# EasyEDA Pro project wavie-main-board-v0.1.epro, schematic Wavie Schematic
Board Name: Wavie; Create Date: 2025-11-19; Page Name: P1; Project Name: Wavie V0.1; Schematic Name: Wavie Schematic; Update Date: 2026-07-30; Company: ReefMetrics; Drawn: ReefMetrics; Page Size: A4; Version: V0.2
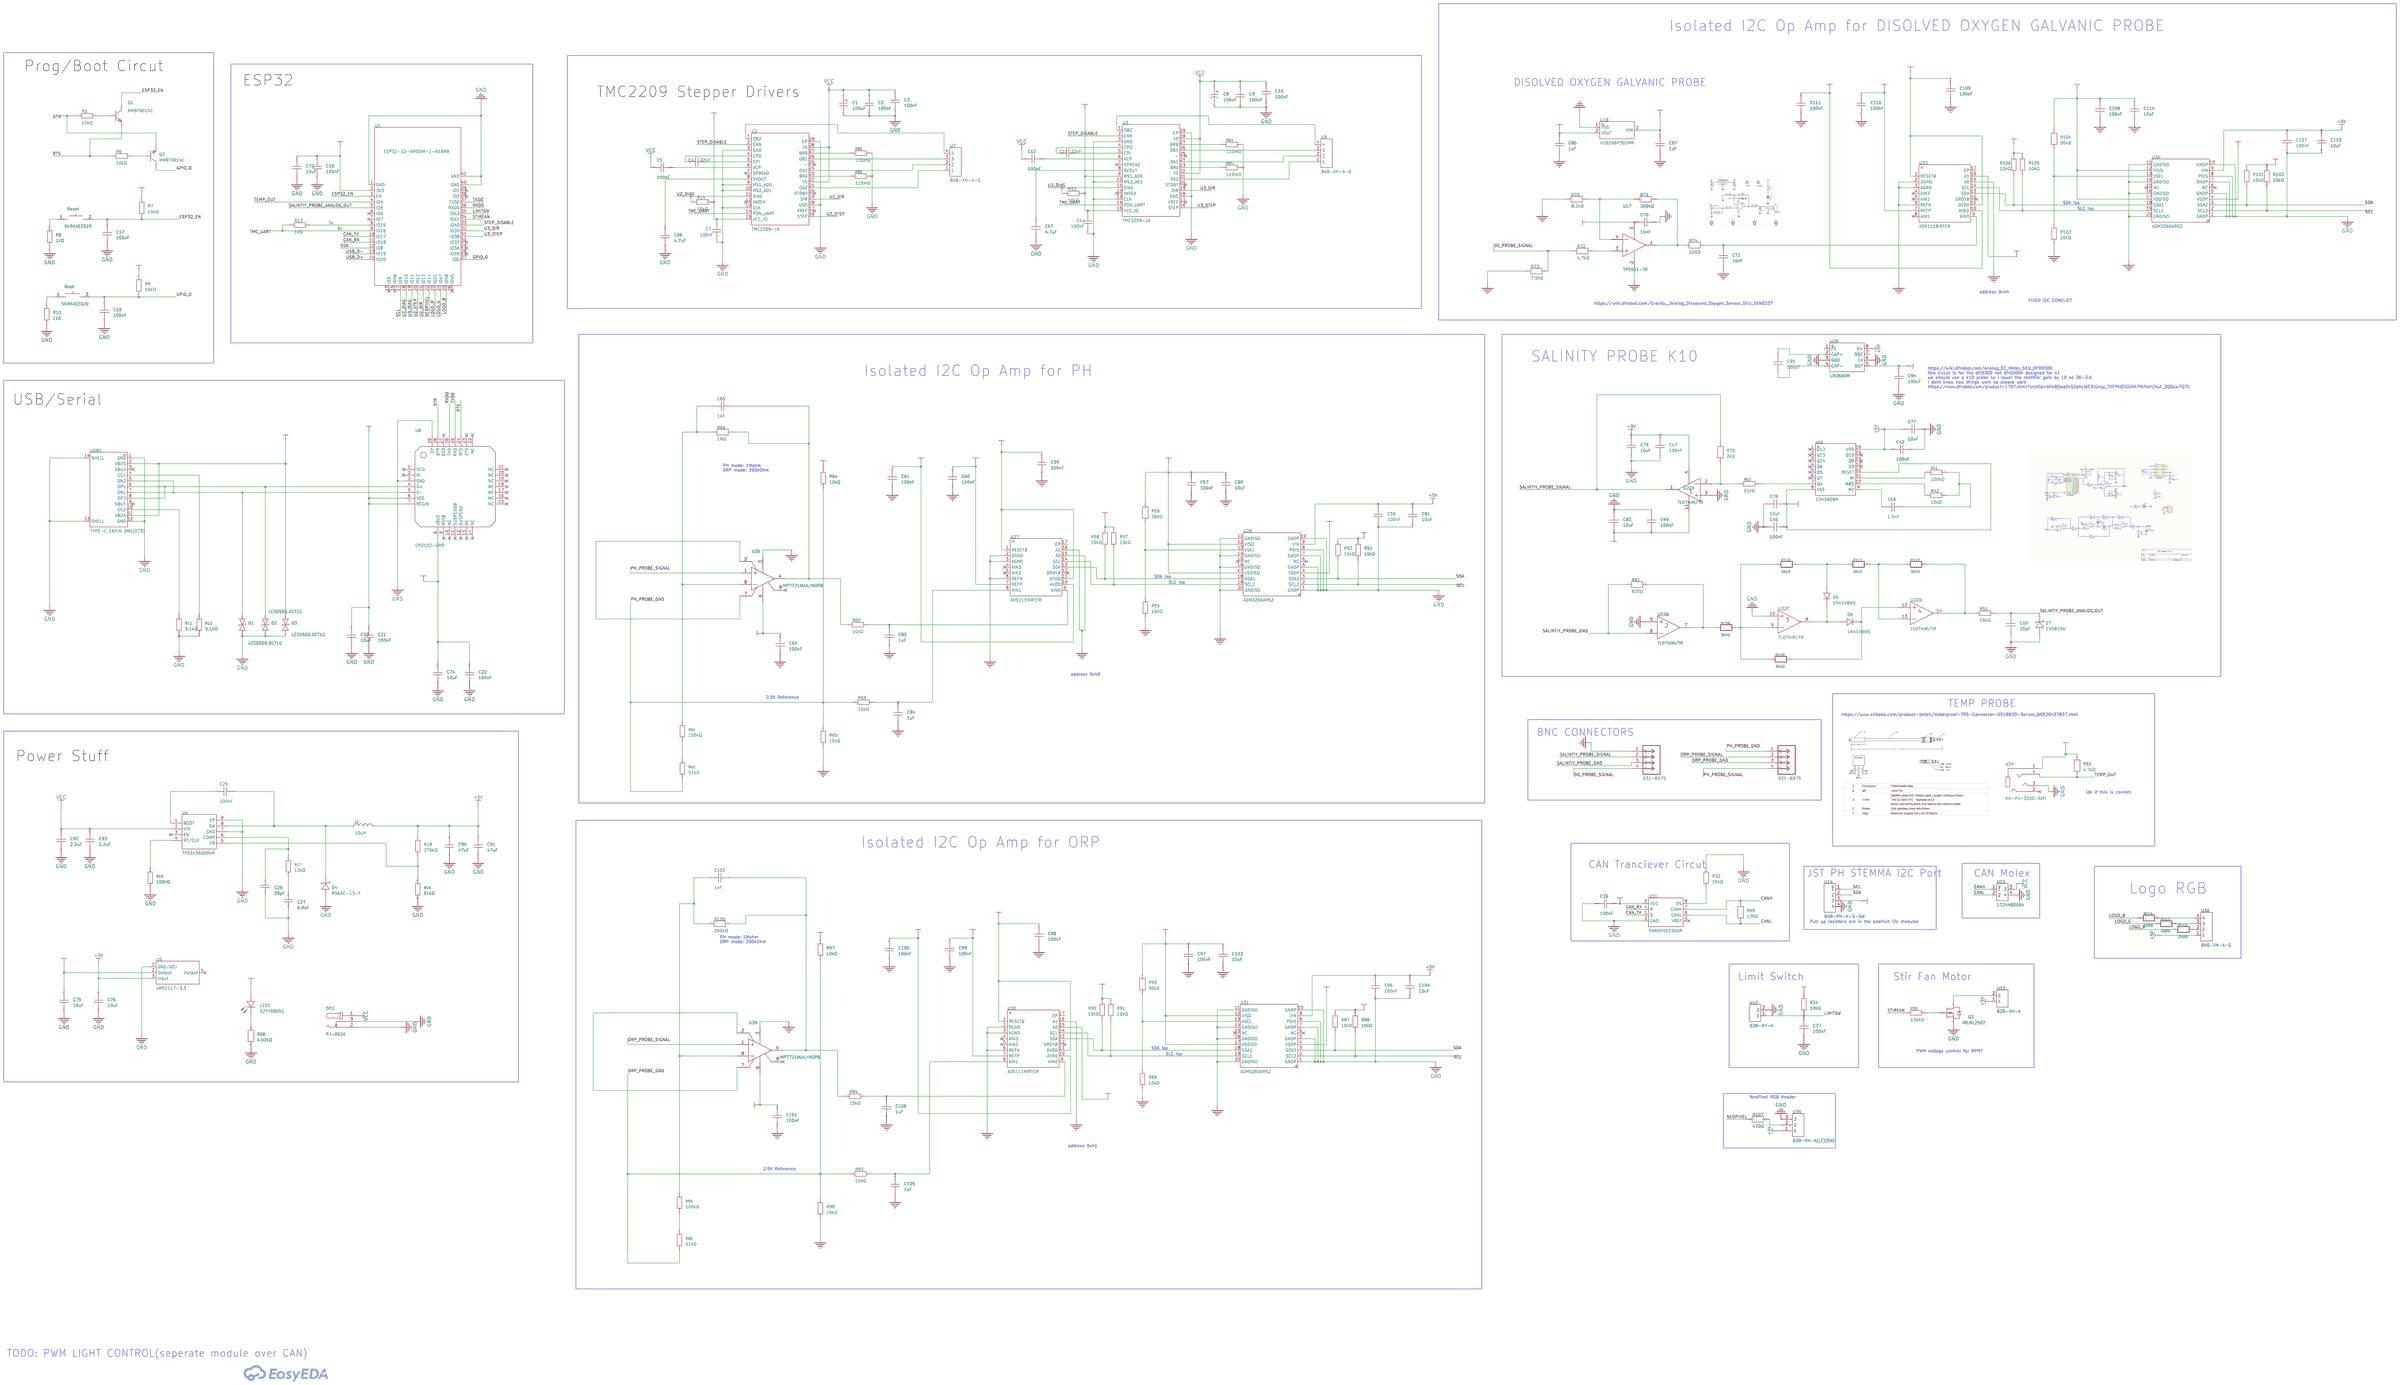
[diagram p0: schematic sheet]

## Parts
Boot  SKRKAEE020  [SW-SMD_L3.9-W3.0-P4.45]
C1  100uF  [CAP-SMD_BD6.3-L6.6-W6.6-LS7.2-FD]
C2  100nF  [C0402]
C3  100nF  [C0402]
C4  22nF  [C0402]
C5  100nF  [C0402]
C7  100nF  [C0402]
C8  100uF  [CAP-SMD_BD6.3-L6.6-W6.6-LS7.2-FD]
C9  100nF  [C0402]
C10  100nF  [C0402]
C11  22nF  [C0402]
C12  100nF  [C0402]
C14  100nF  [C0402]
C16  100nF  [C0402]
C17  100nF  [C0402]
C18  100nF  [C0402]
C21  100nF  [C0402]
C22  100nF  [C0402]
C25  100nF  [C0402]
C26  39pF  [C0402]
C27  6.8nF  [C0402]
C36  100nF  [C0402]
C37  100nF  [C0402]
C42  100nF  [C0402]
C45  100nF  [C0402]
C47  100nF  [C0402]
C49  100nF  [C0402]
C55  100nF  [C0402]
C57  100nF  [C0402]
C59  100nF  [C0402]
C60  100nF  [C0402]
C61  100nF  [C0402]
C64  100nF  [C0402]
C65  1nF  [C0402]
C66  4.7uF  [C0402]
C67  4.7uF  [C0402]
C68  1.5nF  [C0402]
C69  20pF  [C0402]
C70  10nF  [C0402]
C71  10nF  [C0402]
C72  10uF  [C0402]
C73  10uF  [C0402]
C74  10uF  [C0402]
C75  10uF  [C0402]
C76  10uF  [C0402]
C77  10uF  [C0402]
C78  10uF  [C0402]
C79  10uF  [C0402]
C80  10uF  [C0402]
C81  10uF  [C0402]
C83  10uF  [C0402]
C84  1uF  [C0402]
C85  1uF  [C0402]
C86  1uF  [C0402]
C87  1uF  [C0402]
C90  47uF  [C0805]
C91  47uF  [C0805]
C92  2.2uF  [C0402]
C93  2.2uF  [C0402]
C94  100uF  [C0805]
C95  100uF  [C0805]
C96  100nF  [C0402]
C97  100nF  [C0402]
C98  100nF  [C0402]
C99  100nF  [C0402]
C100  100nF  [C0402]
C101  100nF  [C0402]
C102  1nF  [C0402]
C103  10uF  [C0402]
C104  10uF  [C0402]
C105  1uF  [C0402]
C106  1uF  [C0402]
C107  100nF  [C0402]
C108  100nF  [C0402]
C109  100nF  [C0402]
C110  100nF  [C0402]
C111  100nF  [C0402]
C114  10uF  [C0402]
C115  10uF  [C0402]
D1  LESD5D5.0CT1G  [SOD-523_L1.2-W0.8-LS1.6-BI]
D2  LESD5D5.0CT1G  [SOD-523_L1.2-W0.8-LS1.6-BI]
D3  LESD5D5.0CT1G  [SOD-523_L1.2-W0.8-LS1.6-BI]
D4  B560C-13-F  [SMC_L7.1-W6.2-LS8.1-RD]
D5  1N4148WS  [SOD-323_L1.8-W1.3-LS2.5-RD]
D6  1N4148WS  [SOD-323_L1.8-W1.3-LS2.5-RD]
D7  1N5819W  [SOD-123_L2.7-W1.6-LS3.7-RD-1]
DC1  PJ-002A  [DC-IN-TH_PJ-002A]
L1  10uH  [IND-SMD_L7.1-W6.6]
LED1  SZYY0805G  [LED0805-R-RD]
Q1  MMBT9014C  [SOT-23-3_L2.9-W1.3-P1.90-LS2.4-BR]
Q2  MMBT9014C  [SOT-23-3_L2.9-W1.3-P1.90-LS2.4-BR]
Q3  IRLML2502  [SOT-23-3_L2.9-W1.3-P1.90-LS2.4-BR]
R5  10kΩ  [R0402]
R6  10kΩ  [R0402]
R7  10kΩ  [R0402]
R8  1kΩ  [R0402]
R9  10kΩ  [R0402]
R10  1kΩ  [R0402]
R11  5.1kΩ  [R0402]
R12  5.1kΩ  [R0402]
R13  1kΩ  [R0402]
R14  10kΩ  [R0402]
R15  10kΩ  [R0402]
R16  100kΩ  [R0402]
R17  13kΩ  [R0402]
R18  270kΩ  [R0402]
R19  51kΩ  [R0402]
R32  10kΩ  [R0402]
R34  10kΩ  [R0402]
R35  100kΩ  [R0402]
R41  100kΩ  [R0402]
R42  10kΩ  [R0402]
R51  10kΩ  [R0402]
R53  10kΩ  [R0402]
R54  10kΩ  [R0402]
R55  10kΩ  [R0402]
R56  30kΩ  [R0402]
R57  10kΩ  [R0402]
R58  10kΩ  [R0402]
R59  10kΩ  [R0402]
R60  10kΩ  [R0402]
R61  100kΩ  [R0402]
R62  51kΩ  [R0402]
R63  51kΩ  [R0402]
R64  10kΩ  [R0402]
R65  10kΩ  [R0402]
R66  1MΩ  [R0402]
R68  4.02kΩ  [R0402]
R69  120Ω  [R0402]
R70  8.2kΩ  [R0402]
R71  300kΩ  [R0402]
R72  4.7kΩ  [R0402]
R73  7.5kΩ  [R0402]
R74  220Ω  [R0402]
R75  2kΩ  [R0402]
R81  820Ω  [R0402]
R82  4.7kΩ  [R0402]
R83  110mΩ  [R0603]
R84  110mΩ  [R0603]
R85  110mΩ  [R0603]
R86  110mΩ  [R0603]
R87  10kΩ  [R0402]
R88  10kΩ  [R0402]
R89  10kΩ  [R0402]
R90  30kΩ  [R0402]
R91  10kΩ  [R0402]
R92  10kΩ  [R0402]
R93  10kΩ  [R0402]
R94  10kΩ  [R0402]
R95  100kΩ  [R0402]
R96  51kΩ  [R0402]
R97  10kΩ  [R0402]
R98  10kΩ  [R0402]
R100  200kΩ  [R0402]
R101  10kΩ  [R0402]
R102  10kΩ  [R0402]
R103  10kΩ  [R0402]
R104  30kΩ  [R0402]
R105  10kΩ  [R0402]
R106  10kΩ  [R0402]
R107  470Ω  [R0402]
R108  36kΩ  [R0402]
R109  36kΩ  [R0402]
R110  36kΩ  [R0402]
R111  36kΩ  [R0402]
R112  36kΩ  [R0402]
R113  100Ω  [R0402]
R114  100Ω  [R0402]
R115  150Ω  [R0402]
Reset  SKRKAEE020  [SW-SMD_L3.9-W3.0-P4.45]
U1  ESP32-S3-WROOM-1-N16R8  [WIRELM-SMD_ESP32-S3-WROOM-1]
U2  TMC2209-LA  [QFN-28_L5.0-W5.0-P0.50-BL-EP]
U3  TMC2209-LA  [QFN-28_L5.0-W5.0-P0.50-BL-EP]
U4  TPS54360DDAR  [SOIC-8_L5.0-W4.0-P1.27-LS6.0-BL-EP2.0]
U5  AMS1117-3.3  [SOT-223-4_L6.5-W3.5-P2.30-LS7.0-BR]
U7  B4B-XH-A-G  [CONN-TH_B4B-XH-A-G]
U8  CP2102-GMR  [WQFN-28_L5.0-W5.0-P0.50-BL-EP3.2]
U9  B4B-XH-A-G  [CONN-TH_B4B-XH-A-G]
U11  SN65HVD230DR  [SOIC-8_L4.9-W3.9-P1.27-LS6.0-BL]
U12  B2B-XH-A  [CONN-TH_XH-2A]
U13  B2B-XH-A  [CONN-TH_XH-2A]
U14  B4B-PH-K-S-GW  [CONN-TH_B4B-PH-K-S-GW]
U15  1724480004  [CONN-TH_4P-P4.20_1724480004]
U16  031-6575  [CONN_6575_AMP]
U17  TP5551-TR  [SOT-23-5_L3.0-W1.7-P0.95-LS2.8-BR]
U18  XC6206P302MR  [SOT-23-3_L2.9-W1.3-P1.90-LS2.4-BR]
U19  CD4060BM  [SOP-16_L9.9-W3.9-P1.27-LS6.1-BL]
U20  LM2660M  [SOIC-8_L4.9-W3.9-P1.27-LS6.0-BL]
U22  TL074IM/TR  [SOIC-14_L8.6-W3.9-P1.27-LS6.0-BL]  (sections 1,2,3,4)
U23  031-6575  [CONN_6575_AMP]
U24  KH-PJ-320D-SMT  [AUDIO-SMD_KH-PJ-320D-SMT_1]
U26  LMP7721MAX/NOPB  [SOIC-8_L4.9-W3.9-P1.27-LS6.0-BL]
U27  ADS1119IRTER  [WQFN-16_L3.0-W3.0-P0.50-BL-EP0.8]
U28  ADM3260ARSZ  [SSOP-20_L7.5-W5.2-P0.65-LS8.0-TL]
U29  LMP7721MAX/NOPB  [SOIC-8_L4.9-W3.9-P1.27-LS6.0-BL]
U30  ADS1119IRTER  [WQFN-16_L3.0-W3.0-P0.50-BL-EP0.8]
U31  ADM3260ARSZ  [SSOP-20_L7.5-W5.2-P0.65-LS8.0-TL]
U33  ADS1119IRTER  [WQFN-16_L3.0-W3.0-P0.50-BL-EP0.8]
U34  ADM3260ARSZ  [SSOP-20_L7.5-W5.2-P0.65-LS8.0-TL]
U35  B3B-XH-A(LF)(SN)  [CONN-TH_3P-P2.50_A2501WV2-3P]
U36  B4B-XH-A-G  [CONN-TH_B4B-XH-A-G]
USB1  TYPE-C 16PIN 2MD(073)  [USB-C-SMD_TYPE-C-6PIN-2MD-073]

## Library data of the parts
Boot Reset = SKRKAEE020: Circuit:SPST Actuator Style:Round Button Mounting Type:Surface Mount,Vertical Length:3.9mm Width:2.9mm Switch Height:2mm Contact Current:50mA Voltage Rating:12V With Lamp:- Life:-; LCSC Part Name: 3.9*2.9*2mm 立贴 轻触开关; Supplier Part: C115357; Manufacturer: ALPSALPINE(阿尔卑斯阿尔派); Supplier Footprint: SMD; Datasheet: https://item.szlcsc.com/datasheet/SKRKAEE020/116605.html; Supplier: LCSC; Circuit: SPST; Actuator Style: Round Button; Mounting Type: Surface Mount,Vertical; Length: 3.9mm; Width: 2.9mm; Switch Height: 2mm; Contact Current: 50mA; Voltage Rating: 12V
C1 C8 = FZ100UF35V90RV0145: Capacitance:100uF Tolerance:±20% Tolerance:±20% Voltage Rating:35V Ripple Current:280mA@120Hz Equivalent Series Resistance(ESR):- Diameter:6.3mm Height - Seated (Max):7.7mm Lifetime:3000hrs@105℃ Operating Temperature:-55℃~+105℃ Operating Temperature:-55℃~; LCSC Part Name: 100uF ±20% 35V; Supplier Part: C5155339; Manufacturer: KNSCHA(科尼盛); Supplier Footprint: SMD,D6.3xL7.7mm; JLCPCB Part Class: Extended Part; Datasheet: https://item.szlcsc.com/datasheet/FZ100UF35V90RV0145/5785014.html; Supplier: LCSC; Tolerance: ±20%; Voltage Rating: 35V; Ripple Current: 280mA@120Hz; Diameter: 6.3mm; Height - Seated (Max): 7.7mm; Lifetime: 3000hrs@105℃; Operating Temperature: -55℃~+105℃
C2 C3 C5 C7 C9 C10 C12 C14 C25 C36 C37 C42 C45 C47 C49 C55 C57 C59-C61 C64 C96-C101 C107-C111 = GCM155R71C104KA55D: Capacitance:100nF Tolerance:±10% Tolerance:±10% Voltage Rating:16V Temperature Coefficient:X7R; LCSC Part Name: 100nF ±10% 16V; Supplier Part: C85857; Manufacturer: muRata(村田); Supplier Footprint: 0402; Datasheet: https://item.szlcsc.com/datasheet/GCM155R71C104KA55D/87033.html; Supplier: LCSC; Tolerance: ±10%; Voltage Rating: 16V; Temperature Coefficient: X7R
C4 C11 = 0402B223K500NT: Capacitance:22nF Tolerance:±10% Tolerance:±10% Voltage Rating:50V Temperature Coefficient:X7R; LCSC Part Name: 22nF ±10% 50V; Supplier Part: C1532; Manufacturer: FH(风华); Supplier Footprint: 0402; Datasheet: https://item.szlcsc.com/datasheet/0402B223K500NT/1884.html; Supplier: LCSC; Tolerance: ±10%; Voltage Rating: 50V; Temperature Coefficient: X7R
C16-C18 C21 C22 = CL05B104KB54PNC: Capacitance:100nF Tolerance:±10% Tolerance:±10% Voltage Rating:50V Temperature Coefficient:X7R; LCSC Part Name: 100nF ±10% 50V; Supplier Part: C307331; Manufacturer: SAMSUNG(三星); Supplier Footprint: 0402; JLCPCB Part Class: Basic Part; Datasheet: https://item.szlcsc.com/datasheet/CL05B104KB54PNC/291005.html; Supplier: LCSC; Tolerance: ±10%; Voltage Rating: 50V; Temperature Coefficient: X7R
C26 = CC0402JRNPO9BN390: Capacitance:39pF Tolerance:±5% Tolerance:±5% Voltage Rating:50V Temperature Coefficient:NP0; LCSC Part Name: 39pF ±5% 50V; Supplier Part: C106223; Manufacturer: YAGEO(国巨); Supplier Footprint: 0402; JLCPCB Part Class: Extended Part; Datasheet: https://item.szlcsc.com/datasheet/CC0402JRNPO9BN390/107438.html; Supplier: LCSC; Tolerance: ±5%; Voltage Rating: 50V; Temperature Coefficient: NP0
C27 = 0402B682K500NT: Capacitance:6.8nF Tolerance:±10% Tolerance:±10% Voltage Rated: Temperature Coefficient:; LCSC Part Name: 6.8nF ±10% 50V; Supplier Part: C1542; Manufacturer: FH(风华); Supplier Footprint: 0402; Datasheet: https://atta.szlcsc.com/upload/public/pdf/source/20200305/C486355_26A10D38EF8C2A5C37091D0039909270.pdf; Supplier: LCSC; Tolerance: ±10%
C65 C102 = CL05C102JB51PNC: Capacitance:1nF Tolerance:±5% Tolerance:±5% Voltage Rating:50V Temperature Coefficient:C0G; LCSC Part Name: 1nF ±5% 50V; Supplier Part: C22380032; Manufacturer: SAMSUNG(三星); Supplier Footprint: 0402; JLCPCB Part Class: Extended Part; Datasheet: https://item.szlcsc.com/datasheet/CL05C102JB51PNC/23910224.html; Supplier: LCSC; Tolerance: ±5%; Voltage Rating: 50V; Temperature Coefficient: C0G
C66 C67 = CGA0402X5R475M160GT: Capacitance:4.7uF Tolerance:±20% Tolerance:±20% Voltage Rating:16V Temperature Coefficient:X5R; LCSC Part Name: 4.7uF ±20% 16V; Supplier Part: C6119786; Manufacturer: HRE(芯声); Supplier Footprint: 0402; JLCPCB Part Class: Extended Part; Datasheet: https://item.szlcsc.com/datasheet/CGA0402X5R475M160GT/7062492.html; Supplier: LCSC; Tolerance: ±20%; Voltage Rating: 16V; Temperature Coefficient: X5R
C68 = TCC0402X7R152K500AT: Capacitance:1.5nF Tolerance:±10% Tolerance:±10% Voltage Rating:50V Temperature Coefficient:X7R; LCSC Part Name: 1.5nF ±10% 50V; Supplier Part: C880618; Manufacturer: CCTC(三环); Supplier Footprint: 0402; JLCPCB Part Class: Extended Part; Datasheet: https://item.szlcsc.com/datasheet/TCC0402X7R152K500AT/943149.html; Supplier: LCSC; Tolerance: ±10%; Voltage Rating: 50V; Temperature Coefficient: X7R
C69 = FCC0402N200J500AT: Capacitance:20pF Tolerance:±5% Tolerance:±5% Voltage Rating:50V Temperature Coefficient:C0G; LCSC Part Name: 20pF ±5% 50V; Supplier Part: C5137579; Manufacturer: FOJAN(富捷); Supplier Footprint: 0402; JLCPCB Part Class: Extended Part; Datasheet: https://item.szlcsc.com/datasheet/FCC0402N200J500AT/5747031.html; Supplier: LCSC; Tolerance: ±5%; Voltage Rating: 50V; Temperature Coefficient: C0G
C70 C71 = CGA0402X7R103K100GT: Capacitance:10nF Tolerance:±10% Tolerance:±10% Voltage Rating:10V Temperature Coefficient:X7R; LCSC Part Name: 10nF ±10% 10V; Supplier Part: C36911350; Manufacturer: HRE(芯声); Supplier Footprint: 0402; JLCPCB Part Class: Extended Part; Datasheet: https://item.szlcsc.com/datasheet/CGA0402X7R103K100GT/38636238.html; Supplier: LCSC; Tolerance: ±10%; Voltage Rating: 10V; Temperature Coefficient: X7R
C72-C81 C83 C103 C104 C114 C115 = CGA0402X5R106M6R3GT: Capacitance:10uF Tolerance:±20% Tolerance:±20% Voltage Rating:6.3V Temperature Coefficient:X5R; LCSC Part Name: 10uF ±20% 6.3V; Supplier Part: C23692971; Manufacturer: HRE(芯声); Supplier Footprint: 0402; JLCPCB Part Class: Extended Part; Datasheet: https://item.szlcsc.com/datasheet/CGA0402X5R106M6R3GT/25421443.html; Supplier: LCSC; Tolerance: ±20%; Voltage Rating: 6.3V; Temperature Coefficient: X5R
C84-C87 C105 C106 = CGA0402X5R105M160GT: Capacitance:1uF Tolerance:±20% Tolerance:±20% Voltage Rating:16V Temperature Coefficient:X5R; LCSC Part Name: 1uF ±20% 16V; Supplier Part: C46614477; Manufacturer: HRE(芯声); Supplier Footprint: 0402; JLCPCB Part Class: Extended Part; Datasheet: https://item.szlcsc.com/datasheet/CGA0402X5R105M160GT/48763003.html; Supplier: LCSC; Tolerance: ±20%; Voltage Rating: 16V; Temperature Coefficient: X5R
C90 C91 = 0805X5R476M6R3NT: Capacitance:47uF Tolerance:±20% Tolerance:±20% Voltage Rating:6.3V Temperature Coefficient:X5R; LCSC Part Name: 47uF ±20% 6.3V; Supplier Part: C49326690; Manufacturer: AIDE(爱迪电容); Supplier Footprint: 0805; JLCPCB Part Class: Extended Part; Datasheet: https://item.szlcsc.com/datasheet/0805X5R476M6R3NT/51802520.html; Supplier: LCSC; Tolerance: ±20%; Voltage Rating: 6.3V; Temperature Coefficient: X5R
C92 C93 = CL05A225K05NQNC: Capacitance:2.2uF Tolerance:±10% Tolerance:±10% Voltage Rating:16V Temperature Coefficient:X5R; LCSC Part Name: 2.2uF ±10% 16V; Supplier Part: C18213107; Manufacturer: SAMSUNG(三星); Supplier Footprint: 0402; JLCPCB Part Class: Extended Part; Datasheet: https://item.szlcsc.com/datasheet/CL05A225K05NQNC/19388197.html; Supplier: LCSC; Tolerance: ±10%; Voltage Rating: 16V; Temperature Coefficient: X5R
C94 C95 = MSASJ21GBB5107MTCA01: Capacitance:100uF Tolerance:±20% Tolerance:±20% Voltage Rating:6.3V Temperature Coefficient:X5R; LCSC Part Name: JMK212BBJ107MG-TE 100uF ±20% 6.3V; Supplier Part: C5677507; Manufacturer: TAIYO YUDEN(太诱); Supplier Footprint: 0805; JLCPCB Part Class: Extended Part; Datasheet: https://item.szlcsc.com/datasheet/MSASJ21GBB5107MTCA01/6598830.html; Supplier: LCSC; Tolerance: ±20%; Voltage Rating: 6.3V; Temperature Coefficient: X5R
D1-D3 = LESD5D5.0CT1G: Polarity:Bidirectional Reverse Stand-Off Voltage (Vrwm):5V Clamping Voltage:18.6V Peak Pulse Current (Ipp):9.4A@8/20us Peak Pulse Power Dissipation (Ppp):150W@8/20us Voltage - Breakdown:7.8V Reverse Leakage Current (Ir):1uA Operating Temperature:-40℃~+125; LCSC Part Name: 双向ESD 5V截止 峰值脉冲电流：9.4A@8/20us; Supplier Part: C383211; Manufacturer: LRC(乐山无线电); Supplier Footprint: SOD-523; JLCPCB Part Class: Extended Part; Datasheet: https://item.szlcsc.com/datasheet/LESD5D5.0CT1G/356518.html; Supplier: LCSC; Polarity: Bidirectional; Reverse Stand-Off Voltage (Vrwm): 5V; Clamping Voltage: 18.6V; Peak Pulse Current (Ipp): 9.4A@8/20us; Peak Pulse Power Dissipation (Ppp): 150W@8/20us; Voltage - Breakdown: 7.8V; Reverse Leakage Current (Ir): 1uA; Operating Temperature: -40℃~+125℃; level of protection: IEC 61000-4-4；IEC 61000-4-2; Type: ESD; Junction Capacitance: 15pF
D4 = B560C-13-F: Forward Voltage (Vf@If):700mV@5A Reverse Voltage (Vr):60V Rectified Current:5A Reverse Leakage Current (Ir):500uA@60V; LCSC Part Name: 电压:60V 电流:5A; Supplier Part: C85100; Manufacturer: DIODES(美台); Supplier Footprint: SMC(DO-214AB); Datasheet: https://atta.szlcsc.com/upload/public/pdf/source/20171023/C134461_15087453602301052556.pdf; Supplier: LCSC; Forward Voltage (Vf@If): 700mV@5A; Reverse Voltage (Vr): 60V; Rectified Current: 5A; Reverse Leakage Current (Ir): 500uA@60V
D5 D6 = 1N4148WS_C2128: Diode Configuration:Independent Voltage - Forward(Vf@If):1.25V@150mA Voltage - DC Reverse(Vr):100V Current - Rectified:150mA Pd - Power Dissipation:200mW Reverse Leakage Current (Ir):1uA@75V Reverse Recovery Time (trr):4ns Operating Junction Temperature R; LCSC Part Name: 丝印T4 1N4148WS; Supplier Part: C2128; Manufacturer: CJ(江苏长电/长晶); Supplier Footprint: SOD-323; JLCPCB Part Class: Basic Part; Datasheet: https://item.szlcsc.com/datasheet/1N4148WS/2485.html; Supplier: LCSC; Diode Configuration: Independent; Voltage - Forward(Vf@If): 1.25V@150mA; Voltage - DC Reverse(Vr): 100V; Current - Rectified: 150mA; Pd - Power Dissipation: 200mW; Reverse Leakage Current (Ir): 1uA@75V; Reverse Recovery Time (trr): 4ns; Non-Repetitive Peak Forward Surge Current: 2A
D7 = 1N5819W: Diode Configuration:- Voltage - Forward(Vf@If):900mV@3A Voltage - DC Reverse(Vr):40V Current - Rectified:1A Reverse Leakage Current (Ir):1mA@40V Non-Repetitive Peak Forward Surge Current:9A; LCSC Part Name: 电压:40V 电流:1A; Supplier Part: C2905650; Manufacturer: TECH PUBLIC(台舟); Supplier Footprint: SOD-123; JLCPCB Part Class: Extended Part; Datasheet: https://item.szlcsc.com/datasheet/1N5819W/3175947.html; Supplier: LCSC; Voltage - Forward(Vf@If): 900mV@3A; Voltage - DC Reverse(Vr): 40V; Current - Rectified: 1A; Reverse Leakage Current (Ir): 1mA@40V; Non-Repetitive Peak Forward Surge Current: 9A
DC1 = PJ-002A: Inside Contact Diameter:2mm Outside Contact Diameter:5.5mm Current Rating:2.5A Voltage Rating (Max):24V Operating Temperature:-25℃~+85℃ Operating Temperature:-25℃~+85℃; LCSC Part Name: 内径:2mm 外径:5.5mm; Supplier Part: C3096082; Manufacturer: CUI; Supplier Footprint: 插件; JLCPCB Part Class: Extended Part; Datasheet: https://item.szlcsc.com/datasheet/PJ-002A/3655316.html; Supplier: LCSC; Inside Contact Diameter: 2mm; Outside Contact Diameter: 5.5mm; Current Rating: 2.5A; Voltage Rating (Max): 24V; Operating Temperature: -25℃~+85℃
L1 = PSPMAA0603-100M-ANF: Inductance:10uH Tolerance:±20% Tolerance:±20% Current Rating:3A Current - Saturation(Isat):7A DC Resistance(DCR):105mΩ Ratings:AEC-Q200; LCSC Part Name: 10uH ±20% 7A; Supplier Part: C436542; Manufacturer: PROD(谱罗德); Supplier Footprint: SMD,7.1x6.6mm; Datasheet: https://item.szlcsc.com/datasheet/PSPMAA0603-100M-ANF/434321.html; Supplier: LCSC; Tolerance: ±20%; Current Rating: 3A; Current - Saturation(Isat): 7A; DC Resistance(DCR): 105mΩ; Ratings: AEC-Q200
LED1 = SZYY0805G: Illumination Color:Emerald Green Voltage - Forward(Vf):3.1V Voltage - Forward(Vf):3.1V Power(Watts):100mW Forward Current:5mA Wavelength - Dominant:513nm~528nm Wavelength - Dominant:513nm~528nm Peak Wavelength:525nm Lens Color:Water Clear Luminous Intensi; LCSC Part Name: 翠绿; Supplier Part: C434432; Manufacturer: yongyu(永裕光电); Supplier Footprint: 0805; JLCPCB Part Class: Extended Part; Datasheet: https://item.szlcsc.com/datasheet/SZYY0805G/431714.html; Supplier: LCSC; Illumination Color: Emerald Green; Voltage - Forward(Vf): 3.1V; Power(Watts): 100mW; Forward Current: 5mA; Wavelength - Dominant: 513nm~528nm; Peak Wavelength: 525nm; Lens Color: Water Clear; Luminous Intensity: 430mcd; Viewing Angle: 120°; Operating Temperature: -40℃~+85℃
Q1 Q2 = MMBT9014C: type:NPN Current - Collector(Ic):100mA Collector - Emitter Voltage VCEO:45V Pd - Power Dissipation:200mW DC Current Gain:200@1mA,5V DC Current Gain:200@1mA,5V Transition frequency(fT):100MHz Current - Collector Cutoff:50nA Vce Saturation(VCE(sat)):250mV O; LCSC Part Name: NPN 电流:100mA 电压:45V; Supplier Part: C90157; Manufacturer: ST(先科); Supplier Footprint: TO-236; JLCPCB Part Class: Extended Part; Datasheet: https://item.szlcsc.com/datasheet/MMBT9014C/91342.html; Supplier: LCSC; type: NPN; Current - Collector(Ic): 100mA; Collector - Emitter Voltage VCEO: 45V; Pd - Power Dissipation: 200mW; DC Current Gain: 200@1mA,5V; Transition frequency(fT): 100MHz; Current - Collector Cutoff: 50nA; Vce Saturation(VCE(sat)): 250mV; Emitter-Base Voltage(Vebo): 3V
Q3 = IRLML2502_C518800: Number:1 N-Channel Drain to Source Voltage:20V Current - Continuous Drain(Id):3.6A RDS(on):70mΩ@2.5V Pd - Power Dissipation:1W Gate Threshold Voltage (Vgs(th)):1.2V Gate Charge(Qg):4.6nC@4.5V Input Capacitance(Ciss):310pF@15V Reverse Transfer Capacitance; LCSC Part Name: 1个N沟道 耐压:20V 电流:3.6A; Supplier Part: C518800; Manufacturer: HUASHUO(华朔); Supplier Footprint: SOT-23; JLCPCB Part Class: Extended Part; Datasheet: https://item.szlcsc.com/datasheet/IRLML2502/535298.html; Supplier: LCSC; Number: 1 N-Channel; Drain to Source Voltage: 20V; Current - Continuous Drain(Id): 3.6A; RDS(on): 70mΩ@2.5V; Pd - Power Dissipation: 1W; Gate Threshold Voltage (Vgs(th)): 1.2V; Gate Charge(Qg): 4.6nC@4.5V; Input Capacitance(Ciss): 310pF@15V; Reverse Transfer Capacitance (Crss@Vds): 35pF@15V; Operating Temperature: -55℃~+150℃
R5-R7 R9 R14 R15 R32 R34 R42 R51 R53-R55 R57-R60 R64 R65 R87-R89 R91-R94 R97 R98 R101-R103 R105 R106 = 0402WGF1002TCE: Type:Thick Film Resistor Resistance:10kΩ Tolerance:±1% Tolerance:±1% Power(Watts):62.5mW Voltage-Supply(Max):50V Temperature Coefficient:±100ppm/℃ Temperature Coefficient:±100ppm/℃ Operating Temperature:-55℃~+155℃ Operating Temperature:-55℃~+155℃; LCSC Part Name: 10kΩ ±1% 62.5mW 厚膜电阻; Supplier Part: C25744; Manufacturer: UNI-ROYAL(厚声); Supplier Footprint: 0402; JLCPCB Part Class: Basic Part; Datasheet: https://item.szlcsc.com/datasheet/0402WGF1002TCE/26487.html; Supplier: LCSC; Type: Thick Film Resistor; Tolerance: ±1%; Power(Watts): 62.5mW; Voltage-Supply(Max): 50V; Temperature Coefficient: ±100ppm/℃; Operating Temperature: -55℃~+155℃
R8 R10 R13 = 0402WGF1001TCE: Type:Thick Film Resistor Resistance:1kΩ Tolerance:±1% Tolerance:±1% Power(Watts):62.5mW Voltage-Supply(Max):50V Temperature Coefficient:±100ppm/℃ Temperature Coefficient:±100ppm/℃ Operating Temperature:-55℃~+155℃ Operating Temperature:-55℃~+155℃; LCSC Part Name: 1kΩ ±1% 62.5mW 厚膜电阻; Supplier Part: C11702; Manufacturer: UNI-ROYAL(厚声); Supplier Footprint: 0402; Datasheet: https://item.szlcsc.com/datasheet/0402WGF1001TCE/12256.html; Supplier: LCSC; Type: Thick Film Resistor; Tolerance: ±1%; Power(Watts): 62.5mW; Voltage-Supply(Max): 50V; Temperature Coefficient: ±100ppm/℃; Operating Temperature: -55℃~+155℃
R11 R12 = 0402WGF5101TCE: Type:Thick Film Resistor Resistance:5.1kΩ Tolerance:±1% Tolerance:±1% Power(Watts):62.5mW Voltage-Supply(Max):50V Temperature Coefficient:±100ppm/℃ Temperature Coefficient:±100ppm/℃ Operating Temperature:-55℃~+155℃ Operating Temperature:-55℃~+155℃; LCSC Part Name: 5.1kΩ ±1% 62.5mW 厚膜电阻; Supplier Part: C25905; Manufacturer: UNI-ROYAL(厚声); Supplier Footprint: 0402; Datasheet: https://item.szlcsc.com/datasheet/0402WGF5101TCE/26648.html; Supplier: LCSC; Type: Thick Film Resistor; Tolerance: ±1%; Power(Watts): 62.5mW; Voltage-Supply(Max): 50V; Temperature Coefficient: ±100ppm/℃; Operating Temperature: -55℃~+155℃
R16 R35 R41 R61 R95 = 0402WGF1003TCE: Type:Thick Film Resistor Resistance:100kΩ Tolerance:±1% Tolerance:±1% Power(Watts):62.5mW Voltage-Supply(Max):50V Temperature Coefficient:±100ppm/℃ Temperature Coefficient:±100ppm/℃ Operating Temperature:-55℃~+155℃ Operating Temperature:-55℃~+155℃; LCSC Part Name: 100kΩ ±1% 62.5mW 厚膜电阻; Supplier Part: C25741; Manufacturer: UNI-ROYAL(厚声); Supplier Footprint: 0402; Datasheet: https://item.szlcsc.com/datasheet/0402WGF1003TCE/26484.html; Supplier: LCSC; Type: Thick Film Resistor; Tolerance: ±1%; Power(Watts): 62.5mW; Voltage-Supply(Max): 50V; Temperature Coefficient: ±100ppm/℃; Operating Temperature: -55℃~+155℃
R17 = 0402WGF1302TCE: Type:Thick Film Resistor Resistance:13kΩ Tolerance:±1% Tolerance:±1% Power(Watts):62.5mW Voltage-Supply(Max):50V Temperature Coefficient:±100ppm/℃ Temperature Coefficient:±100ppm/℃ Operating Temperature:-55℃~+155℃ Operating Temperature:-55℃~+155℃; LCSC Part Name: 13kΩ ±1% 62.5mW 厚膜电阻; Supplier Part: C25754; Manufacturer: UNI-ROYAL(厚声); Supplier Footprint: 0402; Datasheet: https://item.szlcsc.com/datasheet/0402WGF1302TCE/26497.html; Supplier: LCSC; Type: Thick Film Resistor; Tolerance: ±1%; Power(Watts): 62.5mW; Voltage-Supply(Max): 50V; Temperature Coefficient: ±100ppm/℃; Operating Temperature: -55℃~+155℃
R18 = RC-02W2703FT: Type:Thick Film Resistors Resistance:270kΩ Tolerance:±1% Tolerance:±1% Power(Watts):62.5mW Voltage-Supply(Max):50V Temperature Coefficient:±200ppm/℃ Temperature Coefficient:±200ppm/℃ Operating Temperature:-55℃~+155℃ Operating Temperature:-55℃~+155℃; LCSC Part Name: 厚膜电阻 270kΩ ±1% 62.5mW 停产; Supplier Part: C290097; Manufacturer: FH(风华); Supplier Footprint: 0402; Datasheet: https://item.szlcsc.com/datasheet/RC-02W2703FT/275051.html; Supplier: LCSC; Type: Thick Film Resistors; Tolerance: ±1%; Power(Watts): 62.5mW; Voltage-Supply(Max): 50V; Temperature Coefficient: ±200ppm/℃; Operating Temperature: -55℃~+155℃
R19 R62 R63 R96 = 0402WGF5102TCE: Type:Thick Film Resistors Resistance:51kΩ Tolerance:±1% Tolerance:±1% Power(Watts): Overload Voltage (Max): Temperature Coefficient:±100ppm/℃ Temperature Coefficient:±100ppm/℃ Operating Temperature Range:-55℃~+155℃ Operating Temperature Range:-55℃~+155℃; LCSC Part Name: 51kΩ ±1% 62.5mW 厚膜电阻; Supplier Part: C25794; Manufacturer: UNI-ROYAL(厚声); Supplier Footprint: 0402; Datasheet: https://atta.szlcsc.com/upload/public/pdf/source/20200306/C422600_1E6D84923E4A46A82E41ADD87F860B5C.pdf; Supplier: LCSC; Type: Thick Film Resistors; Tolerance: ±1%; Temperature Coefficient: ±100ppm/℃; Operating Temperature Range: -55℃~+155℃
R56 R90 R104 = HP02WAF3002TCE: Type:Thick Film Resistor Resistance:30kΩ Tolerance:±1% Tolerance:±1% Power(Watts):100mW Voltage-Supply(Max):50V Temperature Coefficient:±100ppm/℃ Temperature Coefficient:±100ppm/℃ Operating Temperature:-55℃~+155℃ Operating Temperature:-55℃~+155℃; LCSC Part Name: 30kΩ ±1% 100mW 厚膜电阻; Supplier Part: C2759498; Manufacturer: UNI-ROYAL(厚声); Supplier Footprint: 0402; JLCPCB Part Class: Extended Part; Datasheet: https://item.szlcsc.com/datasheet/HP02WAF3002TCE/2878577.html; Supplier: LCSC; Type: Thick Film Resistor; Tolerance: ±1%; Power(Watts): 100mW; Voltage-Supply(Max): 50V; Temperature Coefficient: ±100ppm/℃; Operating Temperature: -55℃~+155℃
R66 = AC0402FR-7W1ML: Type:Thick Film Resistor Resistance:1MΩ Tolerance:±1% Tolerance:±1% Power(Watts):125mW Temperature Coefficient:±100ppm/℃ Temperature Coefficient:±100ppm/℃ Operating Temperature:-55℃~+155℃ Operating Temperature:-55℃~+155℃; LCSC Part Name: 厚膜电阻 1MΩ ±1% 125mW; Supplier Part: C6458712; Manufacturer: YAGEO(国巨); Supplier Footprint: 0402; JLCPCB Part Class: Extended Part; Datasheet: https://item.szlcsc.com/datasheet/AC0402FR-7W1ML/7411883.html; Supplier: LCSC; Type: Thick Film Resistor; Tolerance: ±1%; Power(Watts): 125mW; Temperature Coefficient: ±100ppm/℃; Operating Temperature: -55℃~+155℃
R68 = RT0402BRD074K02L: Type:Thin Film Resistor Resistance: Tolerance:±0.1% Tolerance:±0.1% Power(Watts): Temperature Coefficient:±25ppm/℃ Temperature Coefficient:±25ppm/℃ Operating Temperature:-55℃~+155℃ Operating Temperature:-55℃~+155℃; LCSC Part Name: 薄膜电阻 4.02kΩ ±0.1% 62.5mW; Supplier Part: C852810; Manufacturer: YAGEO(国巨); Supplier Footprint: 0402; JLCPCB Part Class: Extended Part; Datasheet: https://atta.szlcsc.com/upload/public/pdf/source/20200610/C326738_5639A9F1B6EB6E4AE2197577D3456E7F.pdf; Supplier: LCSC; Type: Thin Film Resistor; Tolerance: ±0.1%; Temperature Coefficient: ±25ppm/℃; Operating Temperature: -55℃~+155℃
R69 = FRC0402F1200TS: Type:Thick Film Resistor Resistance:120Ω Tolerance:±1% Tolerance:±1% Power(Watts):62.5mW Voltage-Supply(Max):50V Temperature Coefficient:±100ppm/℃ Temperature Coefficient:±100ppm/℃ Operating Temperature:-55℃~+155℃ Operating Temperature:-55℃~+155℃; LCSC Part Name: 120Ω ±1% 62.5mW 厚膜电阻; Supplier Part: C2909315; Manufacturer: FOJAN(富捷); Supplier Footprint: 0402; JLCPCB Part Class: Extended Part; Datasheet: https://item.szlcsc.com/datasheet/FRC0402F1200TS/3186250.html; Supplier: LCSC; Type: Thick Film Resistor; Tolerance: ±1%; Power(Watts): 62.5mW; Voltage-Supply(Max): 50V; Temperature Coefficient: ±100ppm/℃; Operating Temperature: -55℃~+155℃
R70 = AT0402BRD078K2L: Type:Thin Film Resistor Resistance:8.2kΩ Tolerance:±0.1% Tolerance:±0.1% Power(Watts):62.5mW Voltage-Supply(Max):50V Temperature Coefficient:±25ppm/℃ Temperature Coefficient:±25ppm/℃ Operating Temperature:-55℃~+155℃ Operating Temperature:-55℃~+155℃; LCSC Part Name: 薄膜电阻 8.2kΩ ±0.1% 62.5mW; Supplier Part: C5455455; Manufacturer: YAGEO(国巨); Supplier Footprint: 0402; JLCPCB Part Class: Extended Part; Datasheet: https://item.szlcsc.com/datasheet/AT0402BRD078K2L/6365414.html; Supplier: LCSC; Type: Thin Film Resistor; Tolerance: ±0.1%; Power(Watts): 62.5mW; Voltage-Supply(Max): 50V; Temperature Coefficient: ±25ppm/℃; Operating Temperature: -55℃~+155℃
R71 = FRC0402F3003TS: Type:Thick Film Resistor Resistance:300kΩ Tolerance:±1% Tolerance:±1% Power(Watts):62.5mW Voltage-Supply(Max):50V Temperature Coefficient:±100ppm/℃ Temperature Coefficient:±100ppm/℃ Operating Temperature:-55℃~+155℃ Operating Temperature:-55℃~+155℃; LCSC Part Name: 300kΩ ±1% 62.5mW 厚膜电阻; Supplier Part: C2929999; Manufacturer: FOJAN(富捷); Supplier Footprint: 0402; JLCPCB Part Class: Extended Part; Supplier: LCSC; Type: Thick Film Resistor; Tolerance: ±1%; Power(Watts): 62.5mW; Voltage-Supply(Max): 50V; Temperature Coefficient: ±100ppm/℃; Operating Temperature: -55℃~+155℃
R72 R82 = RC-02K472JT_C48392572: Type:Thick Film Resistor Resistance:4.7kΩ Tolerance:±5% Tolerance:±5% Power(Watts):62.5mW Temperature Coefficient:±100ppm/℃ Temperature Coefficient:±100ppm/℃ Operating Temperature:-55℃~+155℃ Operating Temperature:-55℃~+155℃; LCSC Part Name: 厚膜电阻 4.7kΩ ±5% 62.5mW; Supplier Part: C48392572; Manufacturer: FH(风华); Manufacturer Part: RC-02K472JT; Supplier Footprint: 0402; JLCPCB Part Class: Extended Part; Datasheet: https://item.szlcsc.com/datasheet/RC-02K472JT/50642419.html; Supplier: LCSC; Type: Thick Film Resistor; Tolerance: ±5%; Power(Watts): 62.5mW; Temperature Coefficient: ±100ppm/℃; Operating Temperature: -55℃~+155℃
R73 = FRC0402F7501TS: Type:Thick Film Resistor Resistance:7.5kΩ Tolerance:±1% Tolerance:±1% Power(Watts):62.5mW Voltage-Supply(Max):50V Temperature Coefficient:±100ppm/℃ Temperature Coefficient:±100ppm/℃ Operating Temperature:-55℃~+155℃ Operating Temperature:-55℃~+155℃; LCSC Part Name: 7.5kΩ ±1% 62.5mW 厚膜电阻; Supplier Part: C2960875; Manufacturer: FOJAN(富捷); Supplier Footprint: 0402; JLCPCB Part Class: Extended Part; Supplier: LCSC; Type: Thick Film Resistor; Tolerance: ±1%; Power(Watts): 62.5mW; Voltage-Supply(Max): 50V; Temperature Coefficient: ±100ppm/℃; Operating Temperature: -55℃~+155℃
R74 = FRC0402F2200TS: Type:Thick Film Resistor Resistance:220Ω Tolerance:±1% Tolerance:±1% Power(Watts):62.5mW Voltage-Supply(Max):50V Temperature Coefficient:±100ppm/℃ Temperature Coefficient:±100ppm/℃ Operating Temperature:-55℃~+155℃ Operating Temperature:-55℃~+155℃; LCSC Part Name: 220Ω ±1% 62.5mW 厚膜电阻; Supplier Part: C2909336; Manufacturer: FOJAN(富捷); Supplier Footprint: 0402; JLCPCB Part Class: Extended Part; Datasheet: https://item.szlcsc.com/datasheet/FRC0402F2200TS/3186271.html; Supplier: LCSC; Type: Thick Film Resistor; Tolerance: ±1%; Power(Watts): 62.5mW; Voltage-Supply(Max): 50V; Temperature Coefficient: ±100ppm/℃; Operating Temperature: -55℃~+155℃
R75 = RC0402DR-072KL: Type:Thick Film Resistor Resistance:2kΩ Tolerance:±0.5% Tolerance:±0.5% Power(Watts):63mW Temperature Coefficient:±100ppm/℃ Temperature Coefficient:±100ppm/℃ Operating Temperature:-55℃~+155℃ Operating Temperature:-55℃~+155℃; LCSC Part Name: 厚膜电阻 2kΩ ±0.5% 63mW; Supplier Part: C4078246; Manufacturer: YAGEO(国巨); Supplier Footprint: 0402; JLCPCB Part Class: Extended Part; Datasheet: https://item.szlcsc.com/datasheet/RC0402DR-072KL/4647516.html; Supplier: LCSC; Type: Thick Film Resistor; Tolerance: ±0.5%; Power(Watts): 63mW; Temperature Coefficient: ±100ppm/℃; Operating Temperature: -55℃~+155℃
R81 = FRC0402F8200TS: Type:Thick Film Resistor Resistance:820Ω Tolerance:±1% Tolerance:±1% Power(Watts):62.5mW Voltage-Supply(Max):50V Temperature Coefficient:±100ppm/℃ Temperature Coefficient:±100ppm/℃ Operating Temperature:-55℃~+155℃ Operating Temperature:-55℃~+155℃; LCSC Part Name: 820Ω ±1% 62.5mW 厚膜电阻; Supplier Part: C2909387; Manufacturer: FOJAN(富捷); Supplier Footprint: 0402; JLCPCB Part Class: Extended Part; Datasheet: https://item.szlcsc.com/datasheet/FRC0402F8200TS/3186322.html; Supplier: LCSC; Type: Thick Film Resistor; Tolerance: ±1%; Power(Watts): 62.5mW; Voltage-Supply(Max): 50V; Temperature Coefficient: ±100ppm/℃; Operating Temperature: -55℃~+155℃
R83-R86 = 0603WAF110LT5E: Type:Thick Film Resistors Resistance:110mΩ Tolerance:±1% Tolerance:±1% Power(Watts): Overload Voltage (Max): Temperature Coefficient:±800ppm/℃ Temperature Coefficient:±800ppm/℃ Operating Temperature Range:-55℃~+155℃ Operating Temperature Range:-55℃~+155℃; LCSC Part Name: 110mΩ ±1% 100mW 厚膜电阻; Supplier Part: C247140; Manufacturer: UNI-ROYAL(厚声); Supplier Footprint: 0603; JLCPCB Part Class: Extended Part; Datasheet: https://atta.szlcsc.com/upload/public/pdf/source/20200306/C422600_1E6D84923E4A46A82E41ADD87F860B5C.pdf; Supplier: LCSC; Type: Thick Film Resistors; Tolerance: ±1%; Temperature Coefficient: ±800ppm/℃; Operating Temperature Range: -55℃~+155℃
R100 = CRCW0402200KFKTD: Type:Thick Film Resistor Resistance:200kΩ Tolerance:±1% Tolerance:±1% Power(Watts):62.5mW Temperature Coefficient:±100ppm/℃ Temperature Coefficient:±100ppm/℃ Operating Temperature:-55℃~+155℃ Operating Temperature:-55℃~+155℃; LCSC Part Name: 厚膜电阻 200kΩ ±1% 62.5mW; Supplier Part: C4243312; Manufacturer: VISHAY(威世); Supplier Footprint: 0402; JLCPCB Part Class: Extended Part; Datasheet: https://item.szlcsc.com/datasheet/CRCW0402200KFKTD/4813729.html; Supplier: LCSC; Type: Thick Film Resistor; Tolerance: ±1%; Power(Watts): 62.5mW; Temperature Coefficient: ±100ppm/℃; Operating Temperature: -55℃~+155℃
R107 = FRC0402F4700TS: Type:Thick Film Resistor Resistance:470Ω Tolerance:±1% Tolerance:±1% Power(Watts):62.5mW Voltage-Supply(Max):50V Temperature Coefficient:±100ppm/℃ Temperature Coefficient:±100ppm/℃ Operating Temperature:-55℃~+155℃ Operating Temperature:-55℃~+155℃; LCSC Part Name: 470Ω ±1% 62.5mW 厚膜电阻; Supplier Part: C2909361; Manufacturer: FOJAN(富捷); Supplier Footprint: 0402; JLCPCB Part Class: Extended Part; Supplier: LCSC; Type: Thick Film Resistor; Tolerance: ±1%; Power(Watts): 62.5mW; Voltage-Supply(Max): 50V; Temperature Coefficient: ±100ppm/℃; Operating Temperature: -55℃~+155℃
R108-R112 = CL0402FN36KP: Type:Thick Film Resistor Resistance:36kΩ Tolerance:±1% Tolerance:±1% Power(Watts):62.5mW Voltage-Supply(Max):50V Temperature Coefficient:±200ppm/℃ Temperature Coefficient:±200ppm/℃ Operating Temperature:-55℃~+155℃ Operating Temperature:-55℃~+155℃; LCSC Part Name: 36kΩ ±1% 62.5mW; Supplier Part: C54863933; Manufacturer: 昶龙科技; Supplier Footprint: 0402; JLCPCB Part Class: Extended Part; Datasheet: https://item.szlcsc.com/datasheet/CL0402FN36KP/58361420.html; Supplier: LCSC; Type: Thick Film Resistor; Tolerance: ±1%; Power(Watts): 62.5mW; Voltage-Supply(Max): 50V; Temperature Coefficient: ±200ppm/℃; Operating Temperature: -55℃~+155℃
R113 R114 = FRH0402B1000TS: Type:Thick Film Resistor Resistance:100Ω Tolerance:±0.1% Tolerance:±0.1% Power(Watts):62.5mW Voltage-Supply(Max):50V Temperature Coefficient:±100ppm/℃ Temperature Coefficient:±100ppm/℃ Operating Temperature:-55℃~+155℃ Operating Temperature:-55℃~+155℃; LCSC Part Name: 厚膜电阻 100Ω ±0.1% 62.5mW; Supplier Part: C54102479; Manufacturer: FOJAN(富捷); Supplier Footprint: 0402; JLCPCB Part Class: Extended Part; Datasheet: https://item.szlcsc.com/datasheet/FRH0402B1000TS/57319865.html; Supplier: LCSC; Type: Thick Film Resistor; Tolerance: ±0.1%; Power(Watts): 62.5mW; Voltage-Supply(Max): 50V; Temperature Coefficient: ±100ppm/℃; Operating Temperature: -55℃~+155℃
R115 = FRR0402F1500TS: Type:Thick Film Resistor Resistance:150Ω Tolerance:±1% Tolerance:±1% Power(Watts):62.5mW Voltage-Supply(Max):50V Temperature Coefficient:±100ppm/℃ Temperature Coefficient:±100ppm/℃ Operating Temperature:-55℃~+155℃ Operating Temperature:-55℃~+155℃; LCSC Part Name: 厚膜电阻 150Ω ±1% 62.5mW; Supplier Part: C55020727; Manufacturer: FOJAN(富捷); Supplier Footprint: 0402; JLCPCB Part Class: Extended Part; Datasheet: https://item.szlcsc.com/datasheet/FRR0402F1500TS/58614009.html; Supplier: LCSC; Type: Thick Film Resistor; Tolerance: ±1%; Power(Watts): 62.5mW; Voltage-Supply(Max): 50V; Temperature Coefficient: ±100ppm/℃; Operating Temperature: -55℃~+155℃
U1 = ESP32-S3-WROOM-1-N16R8: LCSC Part Name: 通用型Wi-Fi+低功耗蓝牙MCU模组; Supplier Part: C2913202; Manufacturer: ESPRESSIF(乐鑫); Supplier Footprint: SMD,25.5x18mm; JLCPCB Part Class: Extended Part; Datasheet: https://item.szlcsc.com/datasheet/ESP32-S3-WROOM-1-N16R8/3198300.html; Supplier: LCSC
U2 U3 = TMC2209-LA: Technology:Yes Voltage - Supply:4.75V~29V Voltage - Supply:4.75V~29V Output Current:2.8A Output Current:2.8A Interface:STEP/DIR；UART Step Resolution:256 RDS(on):170mΩ Peak Current:2.8A Operating Temperature:-40℃~+125℃ Operating Temperature:-40℃~+125℃; Supplier Part: C465949; Manufacturer: TRINAMIC; Supplier Footprint: QFN-28-EP(5x5); JLCPCB Part Class: Extended Part; Datasheet: https://atta.szlcsc.com/upload/public/pdf/source/20191203/C465949_E563A3313F5F3F9C62E6E946672F7886.pdf; Supplier: LCSC; Technology: Yes; Voltage - Supply: 4.75V~29V; Output Current: 2.8A; Interface: STEP/DIR；UART; Step Resolution: 256; RDS(on): 170mΩ; Peak Current: 2.8A; Operating Temperature: -40℃~+125℃
U4 = TPS54360DDAR: Function:Step-down type Output Type:Adjustable Input Voltage:4.5V~60V Input Voltage:4.5V~60V Output Voltage:800mV~58.8V Output Voltage:800mV~58.8V Output Current:3.5A Switching Frequency:2.5MHz Switching Frequency:2.5MHz Operating Temperature:-40℃~+150℃@(; LCSC Part Name: 60V输入、3.5A输出降压DC-DC转换器; Supplier Part: C44377; Manufacturer: TI(德州仪器); Supplier Footprint: SOIC-8-EP; JLCPCB Part Class: Extended Part; Datasheet: https://www.ti.com/cn/lit/gpn/tps54360; Supplier: LCSC; Function: Step-down type; Output Type: Adjustable; Input Voltage: 4.5V~60V; Output Voltage: 800mV~58.8V; Output Current: 3.5A; Switching Frequency: 2.5MHz; Operating Temperature: -40℃~+150℃@(TJ); Synchronous Rectification: No; Number of Outputs: 1; Topology: Step-down; Switch tube (built-in/external): Built-in
U5 = AMS1117-3.3_C369933: Output Type:Fixed Voltage - Supply:18V Output Voltage:3.3V Output Voltage:3.3V Output Current:1A Power Supply Rejection Ratio (PSRR):- Voltage Dropout:1.3V@(800mA) standby current:8mA Noise:- Features:Over Temperature Protection Operating Temperature:- Op; LCSC Part Name: 输入18V 输出3.3V 1A; Supplier Part: C369933; Manufacturer: KEXIN(科信); Supplier Footprint: SOT-223-4; Datasheet: https://atta.szlcsc.com/upload/public/pdf/source/20190724/C369933_94137CB0CFA8D6ABD8E5DA714A2C2C4B.pdf; Supplier: LCSC; Output Type: Fixed; Voltage - Supply: 18V; Output Voltage: 3.3V; Output Current: 1A; Voltage Dropout: 1.3V@(800mA); standby current: 8mA; Features: Over Temperature Protection; Output Configuration: Positive; Number of Outputs: 1
U7 U9 U36 = B4B-XH-A-G: Pins Structure:1x4P Pitch:2.5mm Mounting Style:Direct Insert Reference Series:XH Number of Pins:4P Number of Rows:1 Number of PINs Per Row:4 Row Spacing:- Current Rating (Max):3A Contact Material:Brass Contact Plating:Gold Operating Temperature Range:-25℃; LCSC Part Name: 1x4P 间距:2.5mm 直插 系列:XH; Supplier Part: C594232; Manufacturer: JST; Supplier Footprint: 插件,P=2.5mm; Datasheet: https://atta.szlcsc.com/upload/public/pdf/source/20201120/C594232_DD5B967B853D5C0FE2944642B90E06D1.pdf; Supplier: LCSC; Pins Structure: 1x4P; Pitch: 2.5mm; Mounting Style: Direct Insert; Reference Series: XH; Number of Pins: 4P; Number of Rows: 1; Number of PINs Per Row: 4; Current Rating (Max): 3A; Contact Material: Brass; Contact Plating: Gold; Operating Temperature Range: -25℃~+85℃; Rated Voltage (Max): 250V; Plastic Material: PA66; Flame Retardant Rating: UL94V-0; Supplementary Features: K-leg punch; Colour: White; Z-Height of the Board: 7mm; X-Length of Bottom Edge on Board (Spacing Line): 12.4mm; Y-Width of Bottom Edge on Board: 5.75mm
U8 = CP2102-GMR: Applications Function:Transceiver USB Protocol:USB 2.0 Number of Channels:- Voltage - Supply:3V~3.6V Voltage - Supply:3V~3.6V Data Rate:1Mbps Operating Temperature:-40℃~+85℃ Operating Temperature:-40℃~+85℃ Current - Supply:20mA Supply Current (Iq):80uA; LCSC Part Name: 单芯片USB转UART桥接器; Supplier Part: C6568; Manufacturer: SKYWORKS/SILICON LABS(芯科); Supplier Footprint: WQFN-28-EP(5x5); JLCPCB Part Class: Extended Part; Datasheet: https://item.szlcsc.com/datasheet/CP2102-GMR/7033.html; Supplier: LCSC; Applications Function: Transceiver; USB Protocol: USB 2.0; Voltage - Supply: 3V~3.6V; Data Rate: 1Mbps; Operating Temperature: -40℃~+85℃; Current - Supply: 20mA; Supply Current (Iq): 80uA
U11 = SN65HVD230DR_C5342107: Type:CANtransceiver Data Rate:1Mbps Voltage - Supply:3V~3.6V Voltage - Supply:3V~3.6V Current - Supply:- Operating Temperature:-40℃~+125℃ Operating Temperature:-40℃~+125℃; LCSC Part Name: SN65HVD230DR CAN总线收发器; Supplier Part: C5342107; Manufacturer: Tokmas(托克马斯); Supplier Footprint: SOP-8; JLCPCB Part Class: Extended Part; Datasheet: https://item.szlcsc.com/datasheet/SN65HVD230DR/6116577.html; Supplier: LCSC; Type: CANtransceiver; Data Rate: 1Mbps; Voltage - Supply: 3V~3.6V; Operating Temperature: -40℃~+125℃
U12 U13 = B2B-XH-A: Supplier Part: C19272845; Supplier Footprint: Plugin,P=2.5mm; JLCPCB Part Class: Extended Part; Datasheet: https://atta.szlcsc.com/upload/public/pdf/source/20210915/55C2150F8D01CCBD7F61D7DC07E45ED6.pdf; Supplier: LCSC
U14 = B4B-PH-K-S-GW: Pins Structure:1x4P Pitch:2mm Mounting Style:Straight Reference Series:PH Number of Pins:4P Number of Rows:1 Number of PINs Per Row:4 Row Spacing:- Current Rating (Max):2A Contact Material:Brass Contact Plating:Tin Operating Temperature Range:-25℃~+85℃ Op; LCSC Part Name: 1x4P 间距:2mm 直插 系列:PH; Supplier Part: C566011; Manufacturer: JST; Supplier Footprint: 插件,P=2mm; JLCPCB Part Class: Extended Part; Datasheet: https://atta.szlcsc.com/upload/public/pdf/source/20200721/C566011_D7A7E1FCE27087DADB9839A85D6B6EB3.pdf; Supplier: LCSC; Pins Structure: 1x4P; Pitch: 2mm; Mounting Style: Straight; Reference Series: PH; Number of Pins: 4P; Number of Rows: 1; Number of PINs Per Row: 4; Current Rating (Max): 2A; Contact Material: Brass; Contact Plating: Tin; Operating Temperature Range: -25℃~+85℃; Rated Voltage (Max): 100V; Plastic Material: PA66; Flame Retardant Rating: UL94V-0; Supplementary Features: 打K脚; Colour: White; Z-Height of the Board: 6mm; X-Length of Bottom Edge on Board (Spacing Line): 9.9mm; Y-Width of Bottom Edge on Board: 4.5mm
U15 = 1724480004: Supplier Part: C9900152553; Supplier Footprint: 插件; Supplier: LCSC
U16 U23 = 031-6575
U17 = TP5551-TR: Supplier Part: C2759987; Manufacturer: 3PEAK(思瑞浦); Supplier Footprint: SOT-23-5; JLCPCB Part Class: Extended Part; Datasheet: https://item.szlcsc.com/datasheet/TP5551-TR/2880070.html; Supplier: LCSC
U18 = XC6206P302MR: Output Type:Fixed Voltage - Supply:6V Output Voltage:3V Output Voltage:3V Output Current:100mA Power Supply Rejection Ratio (PSRR):40dB@(1kHz) Voltage Dropout:160mV@(50mA) standby current:2uA Features:Over Current Protection；Short Circuit Protection Opera; LCSC Part Name: 高精度、低功耗、高电压正电压稳压器; Supplier Part: C479054; Manufacturer: PUOLOP(迪浦); Supplier Footprint: SOT-23; JLCPCB Part Class: Extended Part; Datasheet: https://item.szlcsc.com/datasheet/XC6206P302MR/486298.html; Supplier: LCSC; Output Type: Fixed; Voltage - Supply: 6V; Output Voltage: 3V; Output Current: 100mA; Power Supply Rejection Ratio (PSRR): 40dB@(1kHz); Voltage Dropout: 160mV@(50mA); standby current: 2uA; Features: Over Current Protection；Short Circuit Protection; Operating Temperature: -40℃~+85℃@(Ta); Output Configuration: Positive; Number of Outputs: 1
U19 = CD4060BM: Logic Type:2-way split Direction:Up Counter Voltage - Supply:3V~18V Voltage - Supply:3V~18V Number of Elements:1 Trigger Type:Falling Edge Reset:Asynchronous Timing:- Count Rate:12MHz Operating Temperature:-55℃~+125℃ Operating Temperature:-55℃~+125℃; LCSC Part Name: 12MHz 14位二进制计数器; Supplier Part: C555139; Manufacturer: TI(德州仪器); Supplier Footprint: SOP-16; Datasheet: https://www.ti.com/cn/lit/gpn/cd4060b; Supplier: LCSC; Logic Type: 2-way split; Direction: Up Counter; Voltage - Supply: 3V~18V; Number of Elements: 1; Trigger Type: Falling Edge; Reset: Asynchronous; Count Rate: 12MHz; Operating Temperature: -55℃~+125℃
U20 = LM2660M: Function:- Output Type:Fixed Input Voltage:1.5V~5.5V Input Voltage:1.5V~5.5V Output Current (Max):100mA Switching Frequency:5kHz；40kHz Operating Temperature:-40℃~+85℃@(TJ) Operating Temperature:-40℃~+85℃@(TJ) Synchronous Rectification:NO Number of Outputs; Supplier Part: C3192668; Manufacturer: TI(德州仪器); Supplier Footprint: SOIC-8; JLCPCB Part Class: Extended Part; Datasheet: https://www.ti.com/cn/lit/gpn/lm2660; Supplier: LCSC; Output Type: Fixed; Input Voltage: 1.5V~5.5V; Output Current (Max): 100mA; Switching Frequency: 5kHz；40kHz; Operating Temperature: -40℃~+85℃@(TJ); Synchronous Rectification: NO; Number of Outputs: 1; Switch tube (built-in/external): 内置
U22 = TL074IM/TR: Number of Channels:- Gain Bandwidth Product:3MHz Ib - Input Bias Current:2.5nA Vos - Input Offset Voltage:3mV Common Mode Rejection Ratio(CMRR):85dB Slew Rate:10V/us Quiescent Current(Iq):1.4mA Rail To Rail:- Input Offset Voltage Drift(Vos TC):- Input Off; Supplier Part: C19193427; Manufacturer: HGSEMI(华冠); Supplier Footprint: SOP-14; JLCPCB Part Class: Extended Part; Datasheet: https://item.szlcsc.com/datasheet/TL074IM%252FTR/20442239.html; Supplier: LCSC; Gain Bandwidth Product: 3MHz; Ib - Input Bias Current: 2.5nA; Vos - Input Offset Voltage: 3mV; Common Mode Rejection Ratio(CMRR): 85dB; Slew Rate: 10V/us; Quiescent Current(Iq): 1.4mA
U24 = KH-PJ-320D-SMT: Connector Type:3.5mm Headphone Jack; LCSC Part Name: 3.5mm耳机座; Supplier Part: C5123147; Manufacturer: kinghelm(金航标); Supplier Footprint: SMD; Datasheet: https://item.szlcsc.com/datasheet/KH-PJ-320D-SMT/5715561.html; Supplier: LCSC; Connector Type: 3.5mm Headphone Jack
U26 U29 = LMP7721MAX/NOPB: Number of Channels:1 Maximum Power Supply Range (Vdd-Vss):5.5V Rail to Rail:Rail-to-Rail Output Gain Bandwidth Product:17MHz Vos - Input Offset Voltage:26uV Input Offset Voltage Drift(Vos TC):1.5uV/℃ Slew Rate:12.76V/us Ib - Input Bias Current:0.003pA Inp; LCSC Part Name: 超低输入偏置电流精密放大器; Supplier Part: C2864387; Manufacturer: TI(德州仪器); Supplier Footprint: SOIC-8; JLCPCB Part Class: Extended Part; Datasheet: https://www.ti.com/cn/lit/gpn/lmp7721; Supplier: LCSC; Number of Channels: 1; Maximum Power Supply Range (Vdd-Vss): 5.5V; Rail to Rail: Rail-to-Rail Output; Gain Bandwidth Product: 17MHz; Vos - Input Offset Voltage: 26uV; Input Offset Voltage Drift(Vos TC): 1.5uV/℃; Slew Rate: 12.76V/us; Ib - Input Bias Current: 0.003pA; Noise density(eN): 6.5nV/√Hz@1kHz; Common Mode Rejection Ratio(CMRR): 100dB; Quiescent Current: 1.3mA; Output Current: 46mA; Operating Temperature: -40℃~+125℃; Single supply: 1.8V~5.5V
U27 U30 U33 = ADS1119IRTER: Resolution(Bits):16 Sampling Rate:1kHz number of channels:4 Voltage - Supply:2.3V~5.5V Voltage - Supply:2.3V~5.5V Interface:I2C differential input:- Integral non - linearity:15LSB Integral non - linearity:15LSB Operating Temperature:-40℃~+125℃ Operating T; LCSC Part Name: 具有I²C接口的4通道、1kSPS、16位△-∑ ADC; Supplier Part: C2670235; Manufacturer: TI(德州仪器); Supplier Footprint: WQFN-16-EP(3x3); JLCPCB Part Class: Extended Part; Datasheet: https://www.ti.com/cn/lit/gpn/ads1119; Supplier: LCSC; Resolution(Bits): 16; Sampling Rate: 1kHz; number of channels: 4; Voltage - Supply: 2.3V~5.5V; Interface: I2C; Integral non - linearity: 15LSB; Operating Temperature: -40℃~+125℃
U28 U31 U34 = ADM3260ARSZ: LCSC Part Name: 集成DC-DC转换器和支持热插拔的双通道I2C隔离器; Supplier Part: C208558; Manufacturer: ADI(亚德诺); Supplier Footprint: SSOP-20-208mil; JLCPCB Part Class: Extended Part; Datasheet: https://atta.szlcsc.com/upload/public/pdf/source/20180424/C208558_C7E51BB98ADF518B81F175C45458906F.pdf; Supplier: LCSC
U35 = B3B-XH-A(LF)(SN): Pins Structure:1x3P Pitch:2.5mm Mounting Type:Through Hole Reference Series:XH Number of Pins:3P Number of Rows:1 Number of PINs Per Row:3 Row Spacing:- Current Rating:3A Contact Material:Brass Contact Plating:Tin Operating Temperature:-25℃~+85℃ Operating; LCSC Part Name: 1x3P 间距:2.5mm 直插 系列:XH; Supplier Part: C144394; Manufacturer: JST; Supplier Footprint: 插件,P=2.5mm; JLCPCB Part Class: Extended Part; Datasheet: https://item.szlcsc.com/datasheet/B3B-XH-A(LF)(SN)/155726.html; Supplier: LCSC; Pins Structure: 1x3P; Pitch: 2.5mm; Mounting Type: Through Hole; Reference Series: XH; Number of Pins: 3P; Number of Rows: 1; Number of PINs Per Row: 3; Current Rating: 3A; Contact Material: Brass; Contact Plating: Tin; Operating Temperature: -25℃~+85℃; Voltage Rating: 250V; Plastic Material: PA66; Flame Retardant Rating: UL94V-0; Supplementary Features: K Pin; Color: White; Z-Height of the Board: 7mm; X-Length of Bottom Edge on Board (Spacing Line): 9.9mm; Y-Width of Bottom Edge on Board: 5.75mm
USB1 = TYPE-C 16PIN 2MD(073): Connector Type:Type-C Protocol Standard:- Gender:Female Mounting Type:Surface Mount, Right Angle Number of Contacts:16P Number of Ports:1 Current Rating-Power:3A Voltage Rating:5V Connect-Disconnect Life:5,000 Cycles Supplementary Features:- Center Height; LCSC Part Name: Type-C 母 卧贴; Supplier Part: C2765186; Manufacturer: SHOU HAN(首韩); Supplier Footprint: SMD; JLCPCB Part Class: Extended Part; Datasheet: https://item.szlcsc.com/datasheet/TYPE-C%252016PIN%25202MD(073)/2901843.html; Supplier: LCSC; Connector Type: Type-C; Gender: Female; Mounting Type: Surface Mount, Right Angle; Number of Contacts: 16P; Number of Ports: 1; Current Rating-Power: 3A; Voltage Rating: 5V; Connect-Disconnect Life: 5,000 Cycles; Detection color: Black; Operating Temperature: -25℃~+85℃

## Nets
+3.3V: C7.2 C14.2 C16.2 C21.2 C36.2 C72.2 C73.2 C75.2 LED1.1(+) R7.2 R9.2 R14.2 R15.2 R34.2 R53.2 R54.2 R82.2 R87.2 R88.2 R101.2 R102.2 U1.2(3V3) U2.15(VCC_IO) U3.9(MS1_AD0) U3.15(VCC_IO) U5.2(Output) U8.6(VDD) U8.7(REGIN) U11.3(VCC) U14.3 U24.1 U28.4(VDDP) U31.4(VDDP) U34.4(VDDP)
+3VDO: C70.1 C86.2 U17.5(V+) U18.2(VOUT)
+5V: C42.2 C47.2 C55.2 C76.2 C77.2 C79.2 C81.2 C90.2 C91.2 C96.2 C104.2 C107.2 C115.2 L1.2 R18.2 U5.3(Input) U13.1 U19.16(VDD) U20.8(V+) U22.4(VCC) U28.9(VIN) U31.9(VIN) U34.9(VIN) U35.1 U36.1
